# Altium schematic sheet MCB.SchDoc
size A4; SheetNumber: 1; SheetTotal: 1
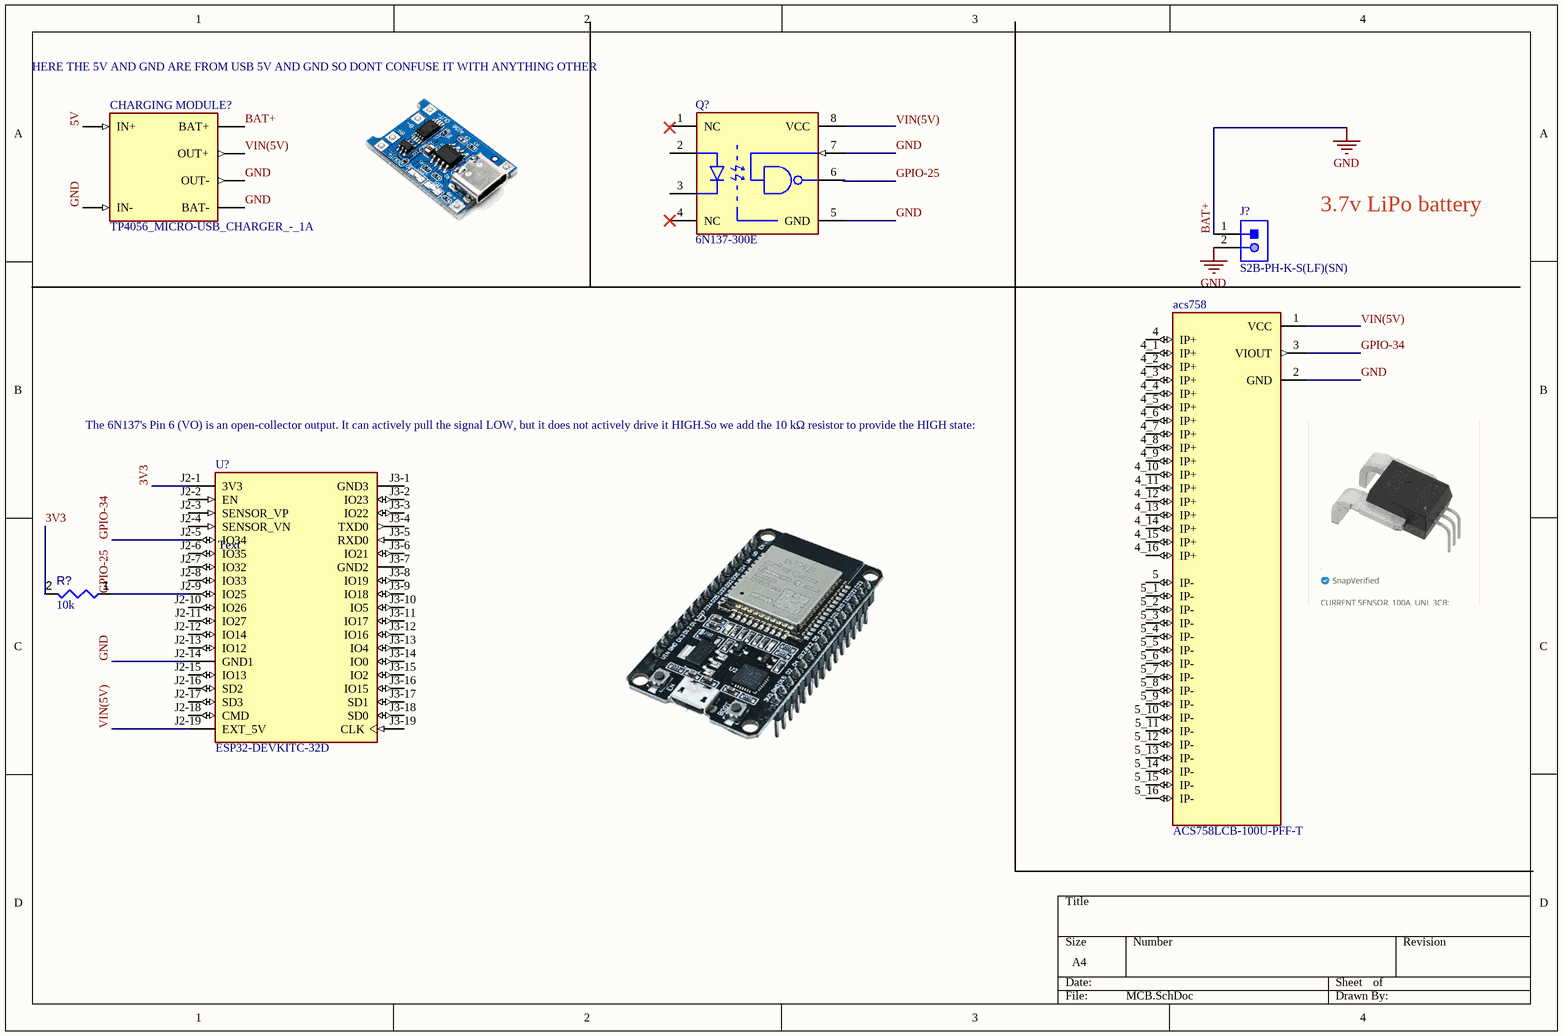
[diagram p0: MCB.SchDoc]

## Parts
acs758  ACS758LCB-100U-PFF-T  [XDCR_ACS758LCB-100U-PFF-T]
CHARGING_MODULE?  TP4056_MICRO-USB_CHARGER_-_1A  [MODULE_TP4056_MICRO-USB_CHARGER_-_1A]
J?  S2B-PH-K-S(LF)(SN)  [JST-S2B-PH-K-S_V]
Q?  6N137-300E  [FP-6N137-300E-MFG]
R?  value 10k  [RESC1608X55X25ML10T15]  (hidden comment: Resistor 100k +/-1% 0603 100 mW)
U?  ESP32-DEVKITC-32D  [MODULE_ESP32-DEVKITC-32D]

## Nets
BAT+: acs758.2(GND) CHARGING_MODULE?.BAT_N(BAT-) CHARGING_MODULE?.BAT_P(BAT+) CHARGING_MODULE?.IN_N(IN-) CHARGING_MODULE?.OUT_N(OUT-) J?.1 J?.2 Q?.5(GND) Q?.7(VE) U?.J2-14(GND1)  [also labelled GND]
3V3: R?.2 U?.J2-1(3V3)
5V: CHARGING_MODULE?.IN_P(IN+)
GPIO-25: R?.1 U?.J2-9(IO25)
GPIO-34: acs758.3(VIOUT) U?.J2-5(IO34)
VIN(5V): CHARGING_MODULE?.OUT_P(OUT+) U?.J2-19(EXT_5V)

Not connected (* = marked no-connect by the designer): acs758 1(VCC) 4(IP+) 4_1(IP+) 4_2(IP+) 4_3(IP+) 4_4(IP+) 4_5(IP+) 4_6(IP+) 4_7(IP+) 4_8(IP+) 4_9(IP+) 4_10(IP+) 4_11(IP+) 4_12(IP+) 4_13(IP+) 4_14(IP+) 4_15(IP+) 4_16(IP+) 5(IP-) 5_1(IP-) 5_2(IP-) 5_3(IP-) 5_4(IP-) 5_5(IP-) 5_6(IP-) 5_7(IP-) 5_8(IP-) 5_9(IP-) 5_10(IP-) 5_11(IP-) 5_12(IP-) 5_13(IP-) 5_14(IP-) 5_15(IP-) 5_16(IP-); Q? 1(NC) 2(A) 3(C) 4(NC)* 6(VO) 8(VCC); U? J2-2(EN) J2-3(SENSOR_VP) J2-4(SENSOR_VN) J2-6(IO35) J2-7(IO32) J2-8(IO33) J2-10(IO26) J2-11(IO27) J2-12(IO14) J2-13(IO12) J2-15(IO13) J2-16(SD2) J2-17(SD3) J2-18(CMD) J3-1(GND3) J3-2(IO23) J3-3(IO22) J3-4(TXD0) J3-5(RXD0) J3-6(IO21) J3-7(GND2) J3-8(IO19) J3-9(IO18) J3-10(IO5) J3-11(IO17) J3-12(IO16) J3-13(IO4) J3-14(IO0) J3-15(IO2) J3-16(IO15) J3-17(SD1) J3-18(SD0) J3-19(CLK)

## Notes on the sheet
- (near CHARGING_MODULE?) HERE THE 5V AND GND ARE FROM USB 5V AND GND SO DONT CONFUSE IT WITH ANYTHING OTHER
- 3.7v LiPo battery
- (near acs758) The 6N137's Pin 6 (VO) is an open-collector output. It can actively pull the signal LOW, but it does not actively drive it HIGH.So we add the 10 kΩ resistor to provide the HIGH state:
- (near U?) Text
- Labels drawn without touching a wire or pin: VIN(5V)

## Library data of the parts
acs758 = CMP-021-000000-1: Current Sensor 100A 1 Channel Hall Effect, Open Loop Unidirectional 5-CB Formed Leads, PFF; MF: Allegro MicroSystems LLC; Value: *; Package: 5-CB-5 Allegro MicroSystems LLC; MP: ACS758LCB-100U-PFF-T; Pin Count: 37; Check_prices: https://www.snapeda.com/parts/ACS758LCB-100U-PFF-T/Allegro/view-part/?ref=eda; Source: ACS758LCB-100U-PFF-T.SchLib; Design Item ID: ACS758LCB-100U-PFF-T; SnapEDA_Link: https://www.snapeda.com/parts/ACS758LCB-100U-PFF-T/Allegro/view-part/?ref=snap; Component Type: Standard
CHARGING_MODULE? = CMP-017-000000-1: The TP4056ES Li-Ion micro USB charger is an improved version of the TP4056, ideal for 18650 batteries, with a micro USB connection for direct PC charging.; MF: Generic; MP: TP4056 Micro-USB Charger - 1A; Design Item ID: TP4056_MICRO-USB_CHARGER_-_1A; Package: Package; Component Type: Standard; SnapEDA_Link: https://www.snapeda.com/parts/TP4056%20Micro-USB%20Charger%20-%201A/Generic/view-part/?ref=snap; Pin Count: 6; Check_prices: https://www.snapeda.com/parts/TP4056%20Micro-USB%20Charger%20-%201A/Generic/view-part/?ref=eda; Value: *; Source: TP4056_MICRO-USB_CHARGER_-_1A.SchLib
J? = CMP-002-00030-2: Male Header, Pitch 2 mm, 1 x 2 Position, Height 4.8 mm, Tail Length 3.4 mm, -25 to 85 degC, RoHS, Bulk; Manufacturer: Japan Solderless Terminals; Package Reference: S2B-PH-K-S; Case/Package: S2B-PH-K-S; Datasheet URL: http://www.jst-mfg.com/product/pdf/eng/ePH.pdf; RoHS Compliant: Unknown; Datasheet Version: Dec-12; Gender: Male; Min Operating Temperature: -25°C; Max Operating Temperature: 85°C; Package Description: Male Header, Pitch 2 mm, 1 x 2 Position, Height 4.8 mm, Tail Length 3.4 mm; Connector Type: Header; Mounting Technology: SM
Q? = CMP-18400-000015-1: OPTOISO 3.75KV OPN COLL 8DIP GW; Manufacturer: Broadcom; Min Supply Voltage: 4.5V; Forward Voltage: 1.5V; Turn Off Delay Time: 50ns; Standoff Height: 0.505mm; Reverse Voltage: 5V; Isolation Voltage: 3750Vrms; Forward Current: 10mA; Turn On Delay Time: 48ns; Max Supply Voltage: 5.5V; Package: 0; Automotive: No; Lead Free: Yes; ComponentLink2Description: Datasheet; Temperature: -40°C to +85°C; Device Class L3: unset; Height: 4.455mm; Ambient Temperature Range Low: -40°C; Digikey Description: OPTOISO 3.75KV OPN COLL 8DIP GW; Temperature Range Low: -40°C; ComponentLink2URL: https://docs.broadcom.com/docs/AV02-0940EN; Mouser Description: High Speed Optocouplers 10 Mb/s 3750Vrms; Category: Trans; Ambient Temperature Range High: +85°C; RoHS: TRUE; Octopart: https://octopart.com/6n137-300e-broadcom-71125550; Manufacturer Part Number: 6N137-300E; Device Class L1: Optoelectronics; Device Class L2: Optocouplers; Temperature Range High: +85°C
R? = CMP-009-00023-5: Chip Resistor, 100 KOhm, +/- 1%, 0.1 W, -55 to 155 degC, 0603 (1608 Metric); Voltage Rating: 50V; Power: 100mW; Max Operating Temperature: 155°C; RoHS Compliant: True; Tolerance: 1%; Pins: 2; Case/Package: 0603; Mounting Technology: SM; Min Operating Temperature: -55°C
U? = CMP-009-000000-1: WiFi Development Tools (802.11) ESP32 General Development Kit, ESP32-WROOM-32D on the board; MF: Espressif Systems; SnapEDA_Link: https://www.snapeda.com/parts/ESP32-DEVKITC-32D/Espressif+Systems/view-part/?ref=snap; Source: ESP32-DEVKITC-32D.SchLib; Design Item ID: ESP32-DEVKITC-32D; Component Type: Standard; Check_prices: https://www.snapeda.com/parts/ESP32-DEVKITC-32D/Espressif+Systems/view-part/?ref=eda; Value: *; Package: None; MP: ESP32-DEVKITC-32D; Pin Count: 38